# Altium schematic sheet USB_Sheet.SchDoc
size A4; DocumentNumber: 19; SheetNumber: 19; SheetTotal: 27
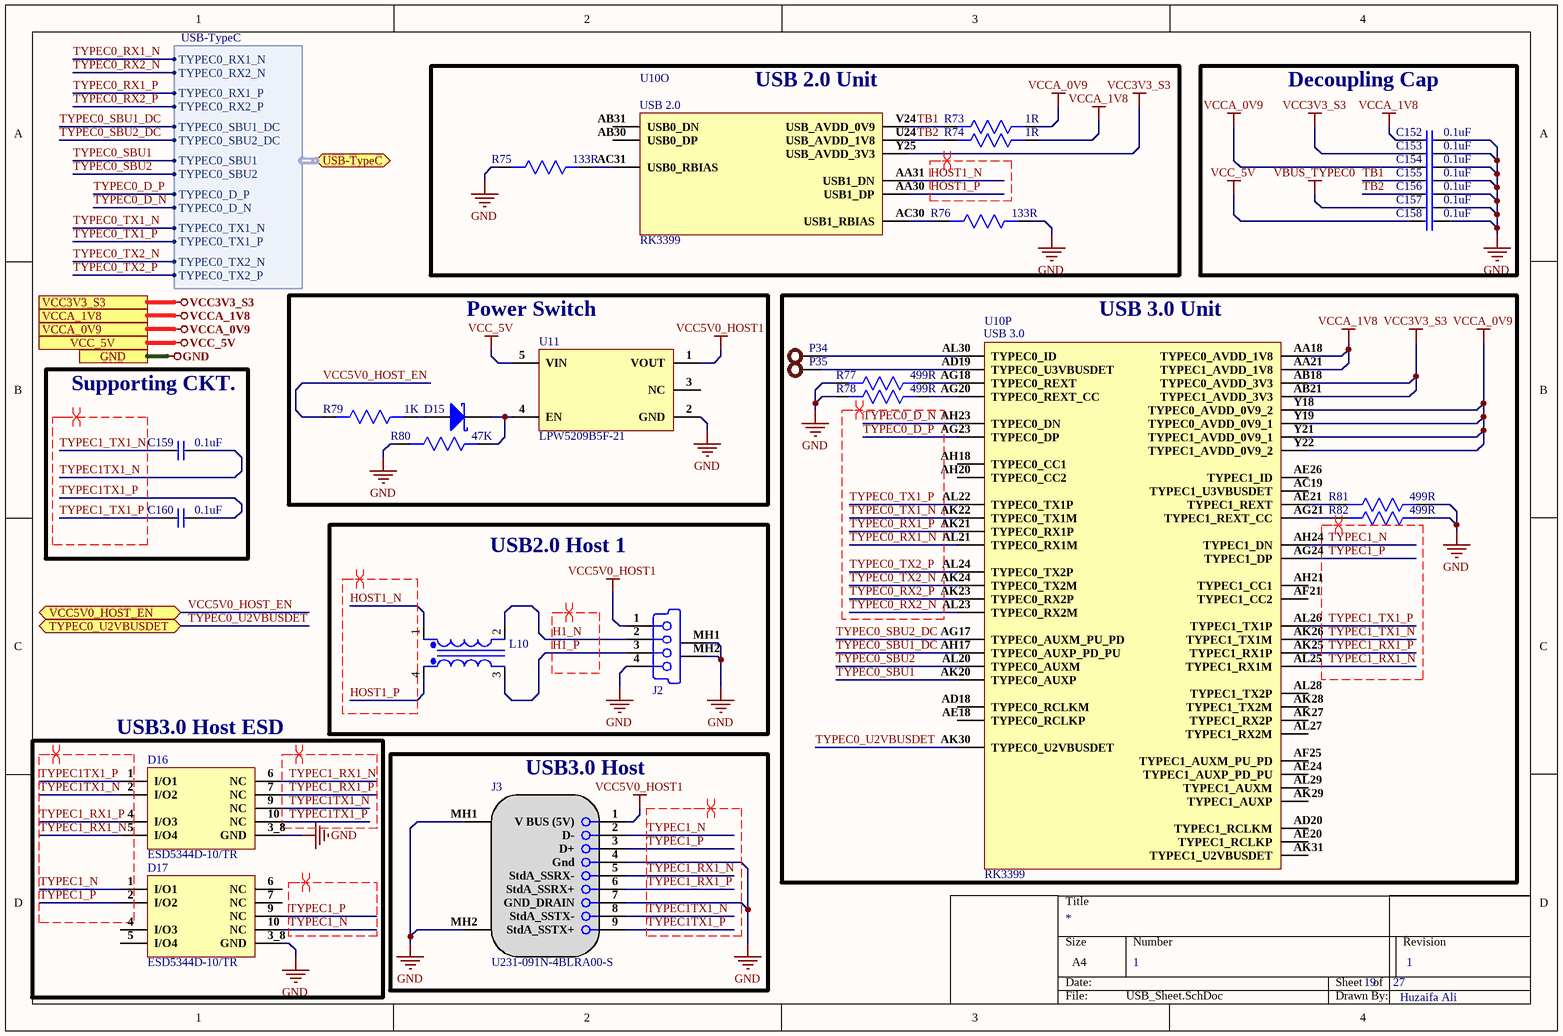
[diagram p0: USB_Sheet.SchDoc]

## Parts
C152  0.1uF  [Cap0402]
C153  0.1uF  [Cap0402]
C154  0.1uF  [Cap0402]
C155  0.1uF  [Cap0402]
C156  0.1uF  [Cap0402]
C157  0.1uF  [Cap0402]
C158  0.1uF  [Cap0402]
C159  0.1uF  [Cap0402]
C160  0.1uF  [Cap0402]
D15  B5819WS  [SOD-323]  (value not drawn)
D16  ESD5344D-10/TR  [DFN2510-10L]
D17  ESD5344D-10/TR  [DFN2510-10L]
J2  61400416021  [61400416021]  (value not drawn)
J3  U231-091N-4BLRA00-S  [U231-091N-4BLRA00-S]
L10  SDCW2012-2-900TF  [SDCW2012-2-900TF]  (value not drawn)
P34  TEST POINT  [TEST POINT]  (value not drawn)
P35  TEST POINT  [TEST POINT]  (value not drawn)
R73  1R  [Res0603]
R74  1R  [Res0603]
R75  133R  [Res0603]
R76  133R  [Res0603]
R77  499R  [Res0603]
R78  499R  [Res0603]
R79  1K  [Res0603]
R80  47K  [Res0603]
R81  499R  [Res0603]
R82  499R  [Res0603]
U10  RK3399  [RK3399]  (parts O,P of 34)
U11  LPW5209B5F-21  [SOT-23-5]

## Blocks framed on the sheet
USB 2.0 Unit: R73-R76 U10
Decoupling Cap: C152-C158
Power Switch: D15 R79 R80 U11
USB 3.0 Unit: P34 P35 R77 R78 R81 R82 U10
Supporting CKT.: C159 C160
USB2.0 Host 1: J2 L10
USB3.0 Host ESD: D16 D17
USB3.0 Host: J3

## Ports
GND, TYPEC0_U2VBUSDET (bidir), USB-TypeC (bidir, harness USB-TypeC), VCC3V3_S3, VCC5V0_HOST_EN (bidir), VCC_5V, VCCA_0V9, VCCA_1V8

## Harnesses
USB-TypeC: TYPEC0_RX1_N, TYPEC0_RX2_N, TYPEC0_RX1_P, TYPEC0_RX2_P, TYPEC0_D_P, TYPEC0_D_N, TYPEC0_TX1_N, TYPEC0_TX1_P, TYPEC0_TX2_N, TYPEC0_TX2_P, TYPEC0_SBU1, TYPEC0_SBU2, TYPEC0_SBU1_DC, TYPEC0_SBU2_DC

## Nets
GND: C152.2 C153.2 C154.2 C155.2 C156.2 C157.2 C158.2 D16.3_8(GND) D17.3_8(GND) J2.4(NC) J2.MH1 J2.MH2 J3.4(Gnd) J3.7(GND_DRAIN) J3.MH1(Tab) J3.MH2(Tab) R75.2 R76.1 R77.2 R78.2 R80.2 R81.1 R82.1 U11.2(GND) ; port GND
VBUS_TYPEC0: C157.1
VCC3V3_S3: C153.1 U10.AB18(TYPEC0_AVDD_3V3) U10.AB21(TYPEC1_AVDD_3V3) U10.Y25(USB_AVDD_3V3) ; port VCC3V3_S3
VCC5V0_HOST1: J2.1(V_BUS_(5V)) J3.1(V_BUS_(5V)) U11.1(VOUT)
VCC_5V: C158.1 U11.5(VIN) ; port VCC_5V
VCCA_0V9: C154.1 R73.1 U10.Y18(TYPEC0_AVDD_0V9_2) U10.Y19(TYPEC0_AVDD_0V9_1) U10.Y21(TYPEC1_AVDD_0V9_1) U10.Y22(TYPEC1_AVDD_0V9_2) ; port VCCA_0V9
VCCA_1V8: C152.1 R74.1 U10.AA18(TYPEC0_AVDD_1V8) U10.AA21(TYPEC1_AVDD_1V8) ; port VCCA_1V8
H1_N: J2.2(D-) L10.2
H1_P: J2.3(D+) L10.3
HOST1_N: L10.1 U10.AA31(USB1_DN)
HOST1_P: L10.4 U10.AA30(USB1_DP)
TB1: C155.1 R73.2 U10.V24(USB_AVDD_0V9)
TB2: C156.1 R74.2 U10.U24(USB_AVDD_1V8)
TYPEC0_D_N: U10.AH23(TYPEC0_DN) ; port USB-TypeC.TYPEC0_D_N
TYPEC0_D_P: U10.AG23(TYPEC0_DP) ; port USB-TypeC.TYPEC0_D_P
TYPEC0_RX1_N: U10.AL21(TYPEC0_RX1M) ; port USB-TypeC.TYPEC0_RX1_N
TYPEC0_RX1_P: U10.AK21(TYPEC0_RX1P) ; port USB-TypeC.TYPEC0_RX1_P
TYPEC0_RX2_N: U10.AL23(TYPEC0_RX2M) ; port USB-TypeC.TYPEC0_RX2_N
TYPEC0_RX2_P: U10.AK23(TYPEC0_RX2P) ; port USB-TypeC.TYPEC0_RX2_P
TYPEC0_SBU1: U10.AK20(TYPEC0_AUXP) ; port USB-TypeC.TYPEC0_SBU1
TYPEC0_SBU1_DC: U10.AH17(TYPEC0_AUXP_PD_PU) ; port USB-TypeC.TYPEC0_SBU1_DC
TYPEC0_SBU2: U10.AL20(TYPEC0_AUXM) ; port USB-TypeC.TYPEC0_SBU2
TYPEC0_SBU2_DC: U10.AG17(TYPEC0_AUXM_PU_PD) ; port USB-TypeC.TYPEC0_SBU2_DC
TYPEC0_TX1_N: U10.AK22(TYPEC0_TX1M) ; port USB-TypeC.TYPEC0_TX1_N
TYPEC0_TX1_P: U10.AL22(TYPEC0_TX1P) ; port USB-TypeC.TYPEC0_TX1_P
TYPEC0_TX2_N: U10.AK24(TYPEC0_TX2M) ; port USB-TypeC.TYPEC0_TX2_N
TYPEC0_TX2_P: U10.AL24(TYPEC0_TX2P) ; port USB-TypeC.TYPEC0_TX2_P
TYPEC0_U2VBUSDET: U10.AK30(TYPEC0_U2VBUSDET) ; port TYPEC0_U2VBUSDET
TYPEC1_N: D17.1(I/O1) D17.10(NC) J3.2(D-) U10.AH24(TYPEC1_DN)
TYPEC1_P: D17.2(I/O2) D17.9(NC) J3.3(D+) U10.AG24(TYPEC1_DP)
TYPEC1_RX1_N: D16.5(I/O4) D16.6(NC) J3.5(StdA_SSRX-) U10.AL25(TYPEC1_RX1M)
TYPEC1_RX1_P: D16.4(I/O3) D16.7(NC) J3.6(StdA_SSRX+) U10.AK25(TYPEC1_RX1P)
TYPEC1_TX1_N: C159.1 U10.AK26(TYPEC1_TX1M)
TYPEC1_TX1_P: C160.1 U10.AL26(TYPEC1_TX1P)
TYPEC1TX1_N: C159.2 D16.2(I/O2) D16.9(NC) J3.8(StdA_SSTX-)
TYPEC1TX1_P: C160.2 D16.1(I/O1) D16.10(NC) J3.9(StdA_SSTX+)
VCC5V0_HOST_EN: R79.2 ; port VCC5V0_HOST_EN
NetD15_1: D15.1(K) R80.1 U11.4(EN)
NetD15_2: D15.2(A) R79.1
NetP34_1: P34.1 U10.AL30(TYPEC0_ID)
NetP35_1: P35.1 U10.AD19(TYPEC0_U3VBUSDET)
NetR75_1: R75.1 U10.AC31(USB0_RBIAS)
NetR76_2: R76.2 U10.AC30(USB1_RBIAS)
NetR77_1: R77.1 U10.AG18(TYPEC0_REXT)
NetR78_1: R78.1 U10.AG20(TYPEC0_REXT_CC)
NetR81_2: R81.2 U10.AE21(TYPEC1_REXT)
NetR82_2: R82.2 U10.AG21(TYPEC1_REXT_CC)

Not connected (* = marked no-connect by the designer): D17 4(I/O3) 5(I/O4) 6(NC) 7(NC); U10 AB30(USB0_DP) AB31(USB0_DN) AC19(TYPEC1_U3VBUSDET) AD18(TYPEC0_RCLKM) AD20(TYPEC1_RCLKM) AE18(TYPEC0_RCLKP) AE20(TYPEC1_RCLKP) AE24(TYPEC1_AUXP_PD_PU) AE26(TYPEC1_ID) AF21(TYPEC1_CC2) AF25(TYPEC1_AUXM_PU_PD) AH18(TYPEC0_CC1) AH20(TYPEC0_CC2) AH21(TYPEC1_CC1) AK27(TYPEC1_RX2P) AK28(TYPEC1_TX2M) AK29(TYPEC1_AUXP) AK31(TYPEC1_U2VBUSDET) AL27(TYPEC1_RX2M) AL28(TYPEC1_TX2P) AL29(TYPEC1_AUXM); U11 3(NC)

## Layout directives
differential pair; differential pair class TYPEC1_IO_Lines; net class TYPEC1; rule Impedance Constraint [Min = 85.00    Max = 90.00    ]; rule Matched Net Lengths [Tolerance = 50mil]: TYPEC1_N, TYPEC1_P, TYPEC1_RX1_N, TYPEC1_RX1_P, TYPEC1_TX1_N, TYPEC1_TX1_P, TYPEC1TX1_N, TYPEC1TX1_P
differential pair; differential pair class HOST1_IO_Lines; net class HOST1; rule Matched Net Lengths [Tolerance = 50mil]; rule Impedance Constraint [Min = 85.00    Max = 90.00    ]: HOST1_N, HOST1_P
differential pair; differential pair class H1_Lines; net class H1; rule Impedance Constraint [Min = 85.00    Max = 90.00    ]; rule Matched Net Lengths [Tolerance = 50mil]: H1_N, H1_P
differential pair; differential pair class TYPEC0_IO_Lines; net class TYPEC0; rule Impedance Constraint [Min = 85.00    Max = 90.00    ]; rule Matched Net Lengths [Tolerance = 50mil]: TYPEC0_D_N, TYPEC0_D_P, TYPEC0_RX1_N, TYPEC0_RX1_P, TYPEC0_RX2_N, TYPEC0_RX2_P, TYPEC0_TX1_N, TYPEC0_TX1_P, TYPEC0_TX2_N, TYPEC0_TX2_P

## Notes on the sheet
- 1
- Huzaifa Ali
- (in symbol RK3399, part O) USB 2.0
- (in symbol RK3399, part P) USB 3.0

## Library data of the parts
C152-C160 = CC0402KRX5R6BB104: CAP CER 0.1UF 10V X5R 0402; Manufacturer: Yageo; Capacitance: 100nF; Tolerance: 10%; Dissipation Factor: 5%; Insulation Resistance: 10GR; Supplier 1: Digi-Key; Manufacturer Part Number: CC0402KRX5R6BB104; RoHS: Yes; Category: Ceramic Capacitors; Stock 1: 6385580; Pricing 1: 1=0.10000, 10=0.02700, 50=0.01500, 100=0.01220, 500=0.00874, 1000=0.00687, 2500=0.00625, 5000=0.00575 (USD); Mount: Surface Mount; Case/Package: 0402; Number of Pins: 2; Case Code (Imperial): 0402; Case Code (Metric): 1005; Min Operating Temperature: -55°C; Max Operating Temperature: 85°C; Dielectric: X5R; Packaging: Tape and Reel; Voltage Rating: 10V; Package Quantity: 1; Termination: SMD/SMT; Voltage Rating (DC): 10V; Series: CC; Length: 1mm; Width: 0.02inch; Height: 0.5mm; Depth: 0.5mm; Thickness: 0.022inch; Radiation Hardening: No; RoHS Compliant: Yes; REACH SVHC: No SVHC; Lead Free: Lead Free; Halogen Free: Halogen Free; ComponentLink1URL: https://datasheet.ciiva.com/144/mlccorderingcode-144029.pdf?src-supplier=Digi-Key; ComponentLink1Description: https://datasheet.ciiva.com/144/mlccorderingcode-144029.pdf?src-supplier=Digi-Key; ComponentLink2URL: https://datasheet.ciiva.com/144/mlccorderingcode-144028.pdf?src-supplier=Digi-Key; ComponentLink2Description: https://datasheet.ciiva.com/144/mlccorderingcode-144028.pdf?src-supplier=Digi-Key; ComponentLink3URL: https://datasheet.ciiva.com/144/mlccorderingcode-144030.pdf?src-supplier=Digi-Key; ComponentLink3Description: https://datasheet.ciiva.com/144/mlccorderingcode-144030.pdf?src-supplier=Digi-Key; ComponentLink4URL: https://datasheet.ciiva.com/7978/1359354-7978091.pdf?src-supplier=Element14; ComponentLink4Description: https://datasheet.ciiva.com/7978/1359354-7978091.pdf?src-supplier=Element14; ComponentLink5URL: https://datasheet.ciiva.com/11587/upy-gphc-x5r-4v-to-50v-12-11587302.pdf?src-supplier=Avnet; ComponentLink5Description: https://datasheet.ciiva.com/11587/upy-gphc-x5r-4v-to-50v-12-11587302.pdf?src-supplier=Avnet; Supplier Part Number 1: 311-1336-1-ND
D15 = B5819WS: DIODE SCHOTTKY 40V 1A SOD323; Manufacturer: MDD; Manufacturer Part Number: B5819WS-TP; Max Surge Current: 10A; Forward Voltage: 900mV; Max Reverse Leakage Current: 1mA; Element Configuration: Single; Supplier 1: Arrow Electronics; RoHS: Yes; Category: Rectifier Diodes; Stock 1: 1701; Pricing 1: 1=0.34370, 10=0.18990, 25=0.18810, 100=0.11820, 250=0.11700, 500=0.08890, 1000=0.07420 (USD); Mount: Surface Mount; Number of Pins: 2; Min Operating Temperature: -65°C; Max Operating Temperature: 125°C; Package Quantity: 1; Packaging: Tape and Reel; Average Rectified Current: 1A; Peak Non-Repetitive Surge Current: 10A; Max Reverse Voltage (DC): 40V; Series: -; Radiation Hardening: No; RoHS Compliant: Yes; Lead Free: Lead Free; Supplier Part Number 1: B5819WS-TP; ComponentLink1Description: LCSC; ComponentLink1URL: https://lcsc.com/product-detail/Schottky-Barrier-Diodes-SBD_MDD-Microdiode-Electronics-B5819WS_C64886.html
D16 D17 = ESD5344D-10/TR: DFN2510-10L ESD Protection Devices ROHS; Manufacturer: WILLSEMI; ComponentLink1Description: LCSC; ComponentLink1URL: https://www.lcsc.com/product-detail/span-style-background-color-ff0-ESD-span-Protection-Devices_WILLSEMI-Will-Semicon-ESD5344D-10-TR_C239666.html; Manufacturer Part Number: ESD5344D-10/TR
J2 = 61400416021: CONN RCPT USB2.0 TYPEA 4POS R/A; Manufacturer: Wurth Electronics; Gender: Receptacle; Connector Type: USB; Number of Contacts: 4; Current Rating: 1A; Voltage Rating: 30V; Number of Ports: 1; Insulation Resistance: 1GR; Supplier 1: Digi-Key; Manufacturer Part Number: 61400416021; Stock 1: 7748; Pricing 1: 1=0.99, 10=0.874, 50=0.823, 100=0.739, 250=0.672 (USD); Mount: Through Hole,Horizontal; Contact Plating: Gold; Contact Material: Copper Alloy; Color: White; Min Operating Temperature: -40°C; Max Operating Temperature: 105°C; Packaging: Tray; Package Quantity: 60; Series: WR-COM; Number of Positions: 4; Termination: Solder; Orientation: Right Angle; USB Standard: USB 2.0; Length: 15.8mm; Width: 14.4mm; REACH SVHC: Unknown; Lead Free: Lead Free; Flammability Rating: UL94 V-0; ComponentLink1URL: https://www.distrelec.biz/Web/Downloads/he/et/4257096_eng_datasheet.pdf?mime=application%2Fpdf&src-supplier=Distrelec; ComponentLink1Description: https://www.distrelec.biz/Web/Downloads/he/et/4257096_eng_datasheet.pdf?mime=application%2Fpdf&src-supplier=Distrelec; ComponentLink2URL: http://www.farnell.com/datasheets/1712150.pdf?src-supplier=Element14; ComponentLink2Description: http://www.farnell.com/datasheets/1712150.pdf?src-supplier=Element14; ComponentLink3URL: http://www.farnell.com/datasheets/1712150.pdf?src-supplier=Newark; ComponentLink3Description: http://www.farnell.com/datasheets/1712150.pdf?src-supplier=Newark; ComponentLink4URL: http://katalog.we-online.de/kataloge/eican/media/pdf/61400416021.pdf?src-supplier=Mouser; ComponentLink4Description: http://katalog.we-online.de/kataloge/eican/media/pdf/61400416021.pdf?src-supplier=Mouser; ComponentLink5URL: https://katalog.we-online.de/em/datasheet/61400416021.pdf?src-supplier=Digi-Key; ComponentLink5Description: https://katalog.we-online.de/em/datasheet/61400416021.pdf?src-supplier=Digi-Key; ComponentLink6URL: http://documents.rs-components.com/techlib://itc_doclist_GB.htm?stockno=7480863&src-supplier=RSComponents; ComponentLink6Description: http://documents.rs-components.com/techlib://itc_doclist_GB.htm?stockno=7480863&src-supplier=RSComponents; ComponentLink7URL: http://www.produktinfo.conrad.com/datenblaetter/1000000-1099999/001088207-da-01-en-WR_COM_USB_TYP_A__61400416021.pdf?src-supplier=Conrad; ComponentLink7Description: http://www.produktinfo.conrad.com/datenblaetter/1000000-1099999/001088207-da-01-en-WR_COM_USB_TYP_A__61400416021.pdf?src-supplier=Conrad; Supplier Part Number 1: 732-2106-ND
J3 = U231-091N-4BLRA00-S: USB 3.0 1.8A 1 260℃ Surface Mount 9 Female -40℃~+85℃ Gold Copper Alloy Type-A SMD USB Connectors ROHS; Manufacturer: XKB Connectivity; Manufacturer Part Number: U231-091N-4BLRA00-S; Footprint: Custom; ComponentLink1Description: LCSC; ComponentLink1URL: https://lcsc.com/product-detail/USB-Connectors_XKB-Connectivity-U231-091N-4BLRA00-S_C2880618.html
L10 = SDCW2012-2-900TF: 90Ω@100MHz -40℃~+85℃ 350mΩ 50V 2 330mA 125V 0805 Common Mode Filters ROHS; Manufacturer: Sunlord; Supplier 1: Digi-Key; Manufacturer Part Number: SDCW2012-2-900TF; RoHS: No; Category: Common Mode Chokes; Supplier Part Number 1: 3442-SDCW2012-2-900TFCT-ND; ComponentLink1Description: LCSC; ComponentLink1URL: https://www.lcsc.com/product-detail/Common-Mode-Filters_Sunlord-SDCW2012-2-900TF_C54888.html
P34 P35 = TEST POINT: Test Point ON
R73 R74 = 0603WAF100KT5E: 1Ω 0603 100mW; Manufacturer: UNI-ROYAL; ComponentLink1Description: LCSC; ComponentLink1URL: https://lcsc.com/product-detail/Chip-span-style-background-color-ff0-Resistor-span-Surface-Mount_UNI-ROYAL-Uniroyal-Elec-0603WAF100KT5E_C22936.html; Manufacturer Part Number: 0603WAF100KT5E; Footprint: 0603
R75 R76 = 0603WAF1330T5E: 133Ω 0603 Chip Resistor - Surface Mount ROHS; Manufacturer: UNI-ROYAL; ComponentLink1Description: LCSC; ComponentLink1URL: https://lcsc.com/product-detail/Chip-span-style-background-color-ff0-Resistor-span-Surface-Mount_UNI-ROYAL-Uniroyal-Elec-0603WAF1330T5E_C22871.html; Manufacturer Part Number: 0603WAF1330T5E; Footprint: 0603
R77 R78 R81 R82 = ERA3AEB4990V: RES SMD 499 OHM 0.1% 1/10W 0603; Manufacturer: Panasonic; Manufacturer Part Number: ERA-3AEB4990V; Power Rating: 100mW; Voltage Rating: 150V; Temperature Coefficient: 25ppm/°C; Voltage Rating (DC): 75V; Supplier 1: Arrow Electronics; RoHS: Yes; Category: Chip SMD Resistors; Stock 1: 4562; Pricing 1: 1=0.31590, 10=0.28840, 25=0.27580, 100=0.11110, 250=0.10990, 500=0.08340, 1000=0.04530, 3000=0.04480 (USD); Mount: Surface Mount; Case/Package: 0603; Number of Pins: 2; Case Code (Metric): 1608; Case Code (Imperial): 0603; Contact Plating: Tin; Min Operating Temperature: -55°C; Max Operating Temperature: 155°C; Resistance: 499R; Tolerance: 0.1%; Packaging: Tape and Reel; Package Quantity: 1; Resistor Type: Thin Film,Metal Film; Number of Terminations: 2; Termination: SMD/SMT; Max Power Dissipation: 100mW; Features: Automotive AEC-Q200; Series: ERA-3A; Resistance Tolerance: 0.1%; Construction: Rectangular; Technology: METAL FILM; Length: 1.6mm; Width: 0.8mm; Height: 0.45mm; Depth: 0.8mm; Radiation Hardening: No; REACH SVHC: No SVHC; Military Standard: Not; Lead Free: Lead Free; RoHS Compliant: Yes; ComponentLink1URL: https://datasheet.ciiva.com/11810/0900766b80eb1d8c-11810911.pdf?src-supplier=RSComponents; ComponentLink1Description: https://datasheet.ciiva.com/11810/0900766b80eb1d8c-11810911.pdf?src-supplier=RSComponents; ComponentLink2URL: https://datasheet.ciiva.com/29183/451973-da-01-en-widerstand-0603-era-29183924.pdf?src-supplier=Conrad; ComponentLink2Description: https://datasheet.ciiva.com/29183/451973-da-01-en-widerstand-0603-era-29183924.pdf?src-supplier=Conrad; ComponentLink3URL: https://datasheet.ciiva.com/6201/485442-6201036.pdf?src-supplier=Farnell; ComponentLink3Description: https://datasheet.ciiva.com/6201/485442-6201036.pdf?src-supplier=Farnell; ComponentLink4URL: https://datasheet.ciiva.com/7920/485442-7920378.pdf?src-supplier=Element14; ComponentLink4Description: https://datasheet.ciiva.com/7920/485442-7920378.pdf?src-supplier=Element14; ComponentLink5URL: https://datasheet.ciiva.com/7920/485442-7920379.pdf?src-supplier=Element14; ComponentLink5Description: https://datasheet.ciiva.com/7920/485442-7920379.pdf?src-supplier=Element14; ComponentLink6URL: https://datasheet.ciiva.com/9181/aoa0000ce26-9181477.pdf?src-supplier=Avnet; ComponentLink6Description: https://datasheet.ciiva.com/9181/aoa0000ce26-9181477.pdf?src-supplier=Avnet; ComponentLink7URL: https://datasheet.ciiva.com/30161/54aoa0000ce26-30161593.pdf?src-supplier=Onlinecomponents.com; ComponentLink7Description: https://datasheet.ciiva.com/30161/54aoa0000ce26-30161593.pdf?src-supplier=Onlinecomponents.com; Supplier Part Number 1: ERA-3AEB4990V
R79 = RT0603DRD071KL: RES SMD 1K OHM 0.5% 1/10W 0603; Manufacturer: Yageo; Resistance: 1kR; Temperature Coefficient: 25ppm/°C; Power Rating: 100mW; Voltage Rating: 75V; Voltage Rating (DC): 50V; Supplier 1: Digi-Key; Manufacturer Part Number: RT0603DRD071KL; Stock 1: 178947; Pricing 1: 1=0.2, 10=0.167, 100=0.0651, 1000=0.02725, 2500=0.02498 (USD); Case/Package: 0603; Contact Plating: Tin,Matte; Case Code (Metric): 1608; Case Code (Imperial): 0603; Min Operating Temperature: -55°C; Max Operating Temperature: 125°C; Tolerance: 0.5%; Composition: Thin Film; Packaging: Tape and Reel; Termination: SMD/SMT; Radiation Hardening: No; Lead Free: Lead Free; ComponentLink1URL: http://www.mouser.com/ds/2/447/yageodocoutput-1125656.pdf?src-supplier=Mouser; ComponentLink1Description: http://www.mouser.com/ds/2/447/yageodocoutput-1125656.pdf?src-supplier=Mouser; ComponentLink2URL: http://www.yageo.com/documents/recent/PYu-RT_1-to-0.05_RoHS_L_6.pdf?src-supplier=Avnet; ComponentLink2Description: http://www.yageo.com/documents/recent/PYu-RT_1-to-0.05_RoHS_L_6.pdf?src-supplier=Avnet; Supplier Part Number 1: 311-1.0KDDKR-ND
R80 = RC0603JR-0747KL: Res Thick Film 0603 30K Ohm 1% 0.1W(1/10W) ±100ppm/C Epoxy Pad SMD T/R; Manufacturer: Yageo; Resistance: 47kR; Tolerance: 5%; Power Rating: 100mW; Voltage Rating (DC): 50V; Temperature Coefficient: 100ppm/°C; Supplier 1: Arrow; Manufacturer Part Number: RC0603JR-0747KL; Stock 1: 599135; Pricing 1: 5000=0.0025, 10000=0.0022, 25000=0.0019, 1=0.0011, 6000=0.001 (USD); Case/Package: 0603; Number of Pins: 2; Case Code (Imperial): 0603; Case Code (Metric): 1608; Min Operating Temperature: -55°C; Max Operating Temperature: 155°C; Packaging: Tape and Reel; Voltage Rating: 50V; Package Quantity: 5000; Termination: SMD/SMT; Military Standard: Not; Composition: Thick Film; Length: 1.6mm; Height: 0.45mm; Width: 0.8mm; Depth: 0.8mm; REACH SVHC: No SVHC; Lead Free: Lead Free; ComponentLink1URL: http://www.farnell.com/datasheets/443971.pdf; ComponentLink1Description: http://www.farnell.com/datasheets/443971.pdf; ComponentLink2URL: http://www.mouser.com/catalog/specsheets/RC0603.pdf; ComponentLink2Description: http://www.mouser.com/catalog/specsheets/RC0603.pdf; Supplier Part Number 1: RC0603JR-0747KL; Supplier 2: Digi-Key; RoHS: Yes; Category: Chip SMD Resistors; Stock 2: 1087850; Pricing 2: 1=0.10000, 10=0.02300, 100=0.00930, 1000=0.00417, 2500=0.00362 (USD); Size Code: 0603; Number of Terminations: 2; Resistor Type: Thick Film; Features: Moisture Resistant; Series: RC; Max Power Dissipation: 100mW; Construction: Rectangular; Resistance Tolerance: 1%; RoHS Compliant: Yes; ComponentLink3URL: https://datasheet.ciiva.com/46395/443971-46395003.pdf?src-supplier=Element14; ComponentLink3Description: https://datasheet.ciiva.com/46395/443971-46395003.pdf?src-supplier=Element14; ComponentLink4URL: https://datasheet.ciiva.com/12558/rc0603-272842-12558744.pdf?src-supplier=Mouser; ComponentLink4Description: https://datasheet.ciiva.com/12558/rc0603-272842-12558744.pdf?src-supplier=Mouser; Supplier Part Number 2: 311-30.0KHRCT-ND
U10 = RK3399: RK3399 CPU BGA for HD set-top box chip BGA Chipse; Manufacturer: Fuzhou Rockchip Electronics; ComponentLink1Description: Aliexpress; ComponentLink1URL: https://www.aliexpress.com/item/1005001971093459.html?spm=a2g0n.productlist.0.0.3c7csv8Qsv8Quh&browser_id=3ac7e9efb8074641aaabc4d871f09748&aff_trace_key=&aff_platform=msite&m_page_id=181389a08711fc2600d8cc522bab8d702dd4189be0&gclid=&pdp_npi=2%40dis%21USD%21%2123.6%21%21%21%21%21%402101d91e16545120399167831e8b89%21%21sea&algo_pvid=4303aedd-774c-4013-953d-920f10b55003; Manufacturer Part Number: RK3399; Footprint: FCBGA828
U11 = LPW5209B5F-21: 2.1Amp SOT-23-5 Power Distribution Switches ROHS; Manufacturer: LOWPOWER; Supplier 1: LCSC; Manufacturer Part Number: LPW5209B5F-21; RoHS: No; Stock 1: 3390; Pricing 1: 5=0.14760, 50=0.12140, 150=0.10820, 500=0.09840, 2500=0.09050, 5000=0.08660 (USD); Supplier Part Number 1: C517266